# Altium schematic sheet Power-Sheet.SchDoc (part 1 of 3)
size 420 x 297 mm; SheetNumber: 2; SheetTotal: 5
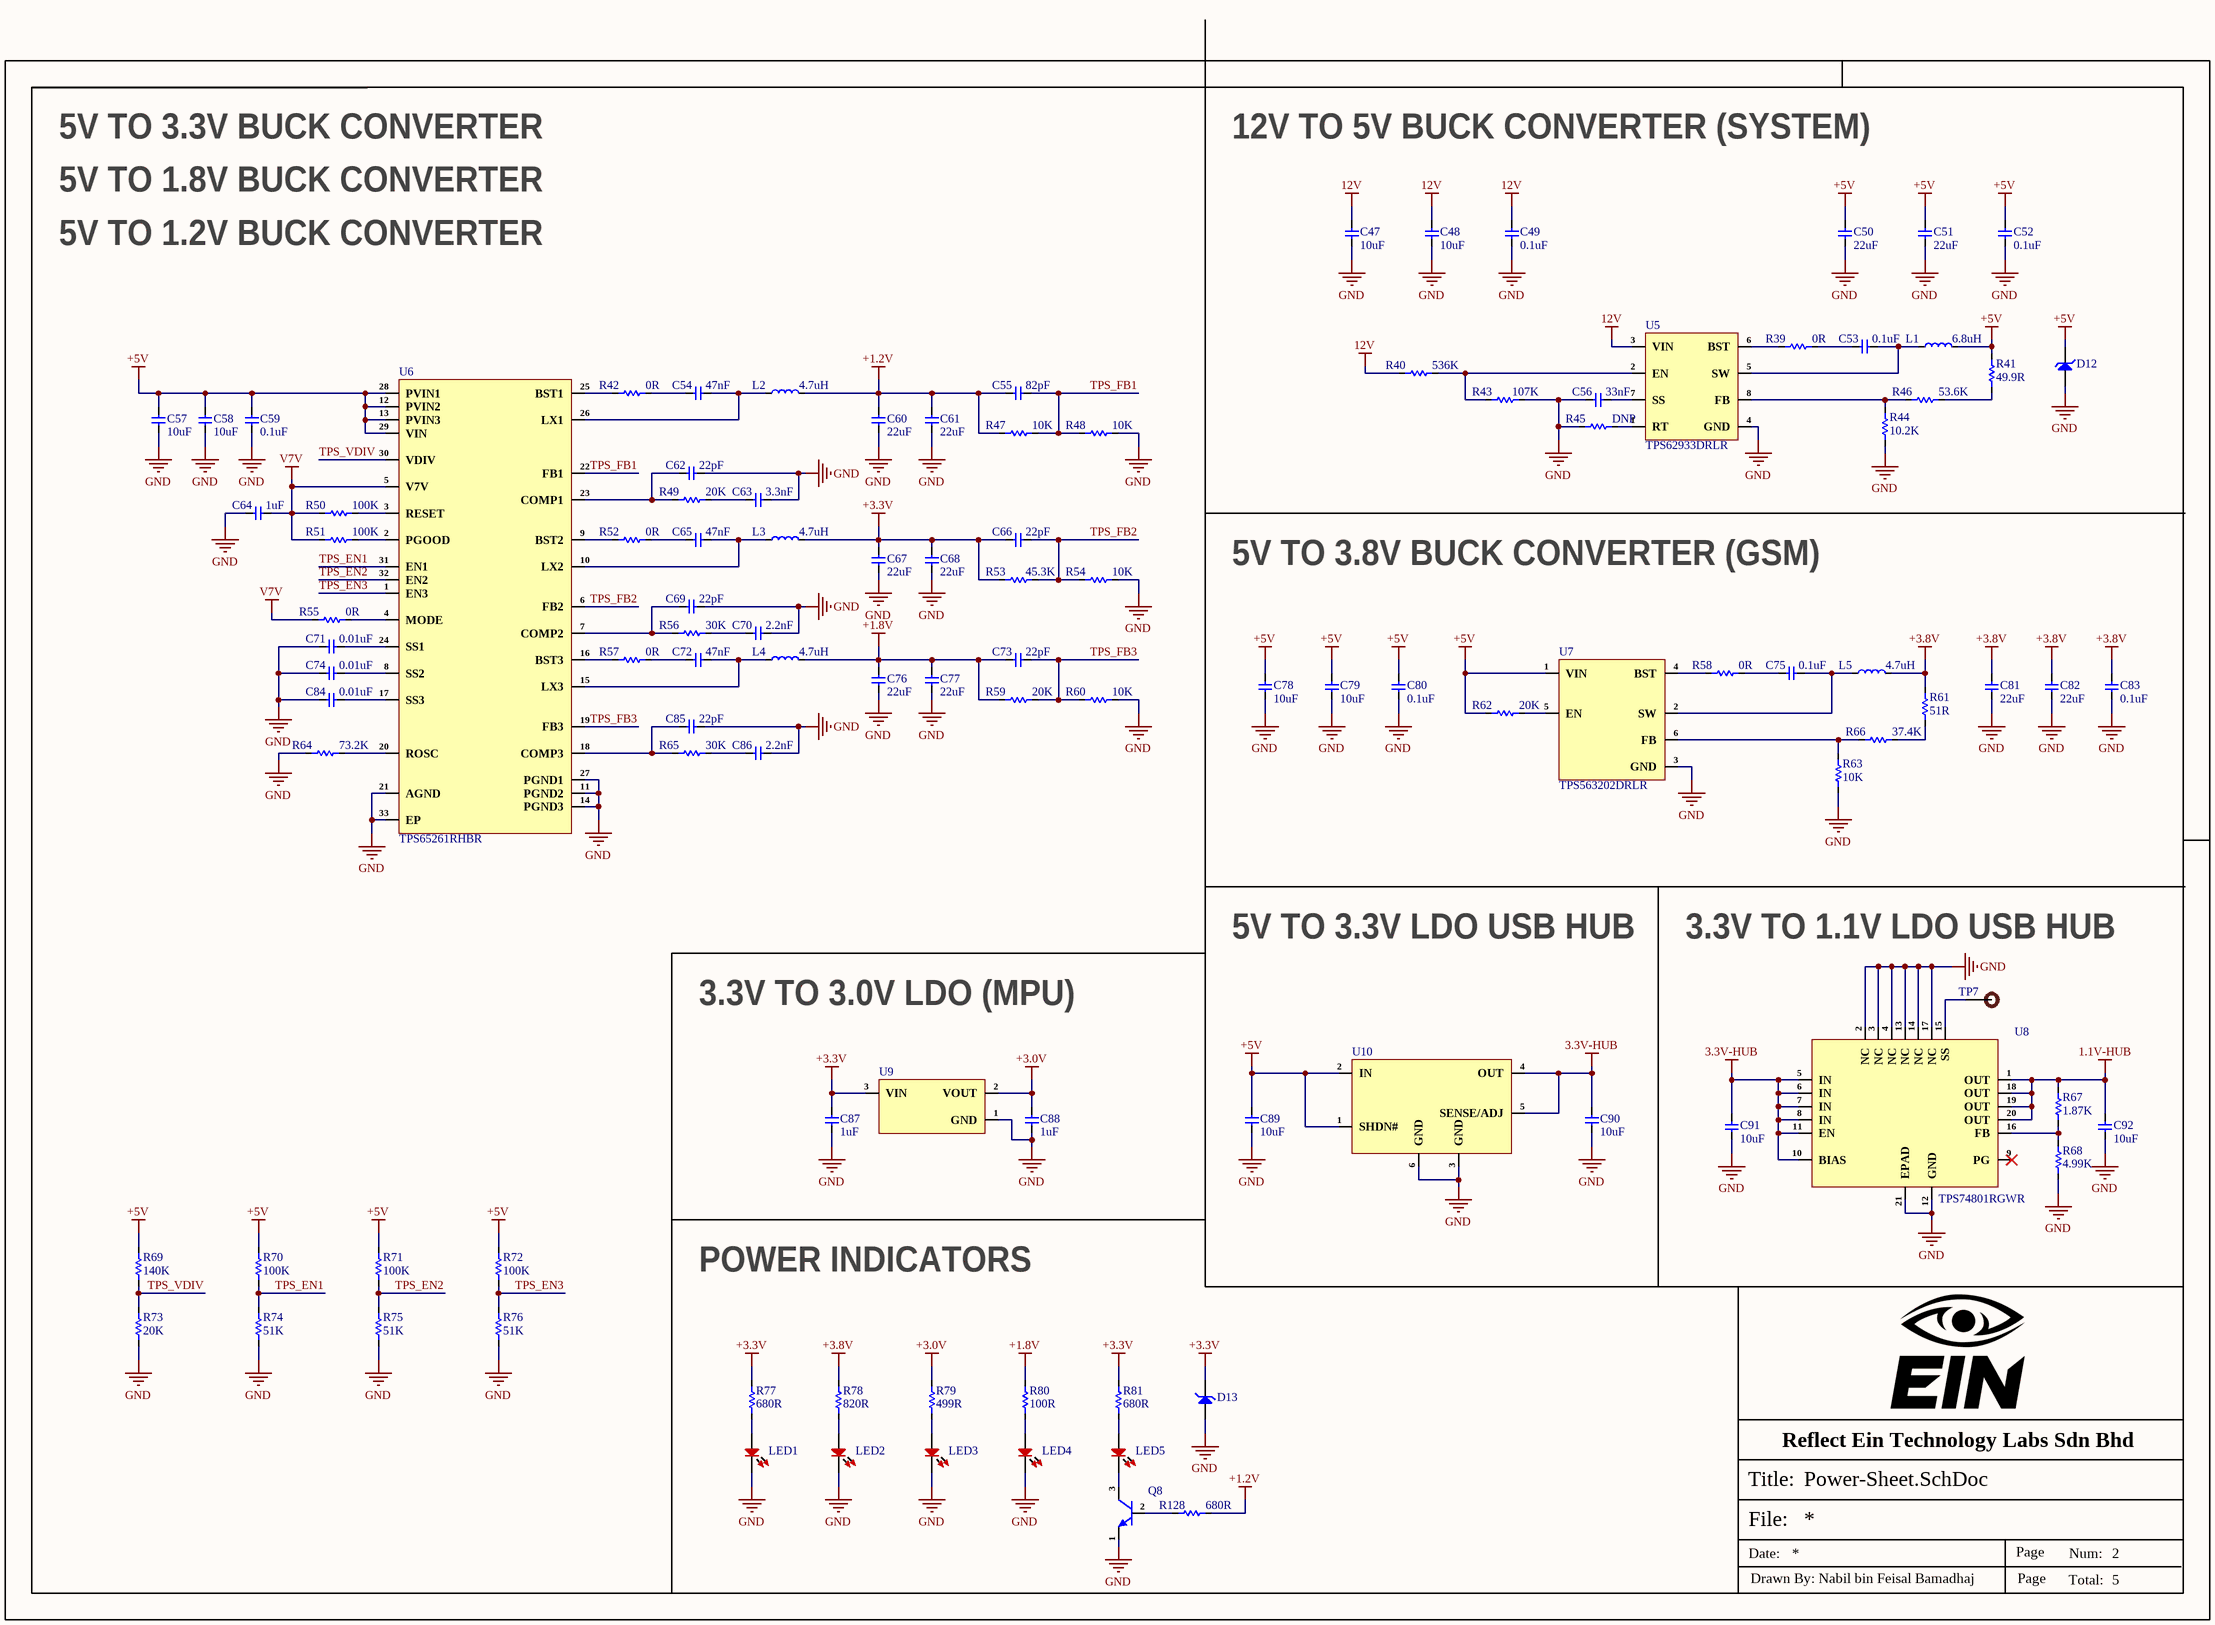
[diagram p0: Power-Sheet.SchDoc]

## Parts
C47  10uF  [Cap-1210]
C48  10uF  [Cap-1210]
C49  0.1uF  [Cap-0603]
C50  22uF  [Cap-0805]
C51  22uF  [Cap-0805]
C52  0.1uF  [Cap-0603]
C53  0.1uF  [Cap-0603]
C54  47nF  [Cap-0603]
C55  82pF  [Cap-0603]
C56  33nF  [Cap-0603]
C57  10uF  [Cap-0603]
C58  10uF  [Cap-0603]
C59  0.1uF  [Cap-0603]
C60  22uF  [Cap-0805]
C61  22uF  [Cap-0805]
C62  22pF  [Cap-0603]
C63  3.3nF  [Cap-0603]
C64  1uF  [Cap-0603]
C65  47nF  [Cap-0603]
C66  22pF  [Cap-0603]
C67  22uF  [Cap-0805]
C68  22uF  [Cap-0805]
C69  22pF  [Cap-0603]
C70  2.2nF  [Cap-0603]
C71  0.01uF  [Cap-0603]
C72  47nF  [Cap-0603]
C73  22pF  [Cap-0603]
C74  0.01uF  [Cap-0603]
C75  0.1uF  [Cap-0603]
C76  22uF  [Cap-0805]
C77  22uF  [Cap-0805]
C78  10uF  [Cap-1210]
C79  10uF  [Cap-1210]
C80  0.1uF  [Cap-0603]
C81  22uF  [Cap-0805]
C82  22uF  [Cap-0805]
C83  0.1uF  [Cap-0603]
C84  0.01uF  [Cap-0603]
C85  22pF  [Cap-0603]
C86  2.2nF  [Cap-0603]
C87  1uF  [Cap-0402]
C88  1uF  [Cap-0402]
C89  10uF  [Cap-1210]
C90  10uF  [Cap-1210]
C91  10uF  [Cap-1210]
C92  10uF  [Cap-1210]
D12  SMBJ5.0A  [SMB_]  (value not drawn)
D13  MSP3V3HM3/89A  [MicroSMP]  (value not drawn)
L1  6.8uH  [ETQP3M6R8KVN]
L2  4.7uH  [SMNR4030-4R7MT]
L3  4.7uH  [SMNR4030-4R7MT]
L4  4.7uH  [SMNR4030-4R7MT]
L5  4.7uH  [SRN4018-4R7M]
LED1  RED  [TH LED 5mm_]  (value not drawn)
LED2  RED  [LED-0603]  (value not drawn)
LED3  RED  [LED-0603]  (value not drawn)
LED4  RED  [LED-0603]  (value not drawn)
LED5  RED  [LED-0603]  (value not drawn)
Q8  MMBT3904  [SOT-23]  (value not drawn)
R39  0R  [Res-0603]
R40  536K  [Res-0603]
R41  49.9R  [Res-0603]
R42  0R  [Res-0603]
R43  107K  [Res-0603]
R44  10.2K  [Res-0603]
R45  DNP  [Res-0603]
R46  53.6K  [Res-0603]
R47  10K  [Res-0603]
R48  10K  [Res-0603]
R49  20K  [Res-0603]
R50  100K  [Res-0603]
R51  100K  [Res-0603]
R52  0R  [Res-0603]
R53  45.3K  [Res-0603]
R54  10K  [Res-0603]
R55  0R  [Res-0603]
R56  30K  [Res-0603]
R57  0R  [Res-0603]
R58  0R  [Res-0603]
R59  20K  [Res-0603]
R60  10K  [Res-0603]
R61  51R  [Res-0603]
R62  20K  [Res-0603]
R63  10K  [Res-0603]
R64  73.2K  [Res-0603]
R65  30K  [Res-0603]
R66  37.4K  [Res-0603]
R67  1.87K  [Res-0402]
R68  4.99K  [Res-0402]
R69  140K  [Res-0603]
R70  100K  [Res-0603]
R71  100K  [Res-0603]
R72  100K  [Res-0603]
R73  20K  [Res-0603]
R74  51K  [Res-0603]
R75  51K  [Res-0603]
R76  51K  [Res-0603]
R77  680R  [Res-0603]
R78  820R  [Res-0603]
R79  499R  [Res-0603]
R80  100R  [Res-0603]
R81  680R  [Res-0603]
R128  680R  [Res-0603]
TP7  TEST POINT 0.5mm Dia  [Test-point - 0.5mm]  (value not drawn)  (no BOM)
U5  TPS62933DRLR  [SOT-583]
U6  TPS65261RHBR  [32-QFN (5x5)]
U7  TPS563202DRLR  [SOT-563]
U8  TPS74801RGWR  [20-VQFN (5x5)]
U9  XC6206P302MR-G  [SOT-23]  (value not drawn)
U10  TPS7A4533DCQR  [SOT-223-6_]  (value not drawn)

## Nets
1.1V-HUB: C92.2 R67.2 U8.1(OUT) U8.18(OUT) U8.19(OUT) U8.20(OUT)
3.3V-HUB: C90.2 C91.2 U8.5(IN) U8.6(IN) U8.7(IN) U8.8(IN) U8.10(BIAS) U8.11(EN) U10.4(OUT) U10.5(SENSE/ADJ)
12V: C47.2 C48.2 C49.2 R40.1 U5.3(VIN)
+1.2V: C55.1 C60.2 C61.2 L2.2 R47.1 R128.1
+1.8V: C73.1 C76.2 C77.2 L4.2 R59.2 R80.2
+3.0V: C88.2 R79.2 U9.2(VOUT)
+3.3V: C66.1 C67.2 C68.2 C87.2 D13.2(K) L3.2 R53.1 R77.2 R81.2 U9.3(VIN)
+3.8V: C81.2 C82.2 C83.2 L5.2 R61.2 R78.2
+5V: C50.2 C51.2 C52.2 C57.2 C58.2 C59.2 C78.2 C79.2 C80.2 C89.2 D12.2(K) L1.2 R41.2 R62.1 R69.2 R70.2 R71.2 R72.2 U6.12(PVIN2) U6.13(PVIN3) U6.28(PVIN1) U6.29(VIN) U7.1(VIN) U10.1(SHDN#) U10.2(IN)
GND: C47.1 C48.1 C49.1 C50.1 C51.1 C52.1 C56.1 C57.1 C58.1 C59.1 C60.1 C61.1 C62.2 C63.2 C64.1 C67.1 C68.1 C69.2 C70.2 C71.1 C74.1 C76.1 C77.1 C78.1 C79.1 C80.1 C81.1 C82.1 C83.1 C84.1 C85.2 C86.2 C87.1 C88.1 C89.1 C90.1 C91.1 C92.1 D12.1(A) D13.1(A) LED1.1 LED2.2 LED3.2 LED4.2 Q8.1(E) R43.2 R44.1 R45.1 R48.2 R54.2 R60.2 R63.1 R64.1 R68.1 R73.1 R74.1 R75.1 R76.1 U5.4(GND) U6.11(PGND2) U6.14(PGND3) U6.21(AGND) U6.27(PGND1) U6.33(EP) U7.3(GND) U8.2(NC) U8.3(NC) U8.4(NC) U8.12(GND) U8.13(NC) U8.14(NC) U8.17(NC) U8.21(EPAD) U9.1(GND) U10.3(GND) U10.6(GND)
V7V: C64.2 R50.1 R51.1 R55.1 U6.5(V7V)
TPS_EN1: R70.1 R74.2 U6.31(EN1)
TPS_EN2: R71.1 R75.2 U6.32(EN2)
TPS_EN3: R72.1 R76.2 U6.1(EN3)
TPS_FB1: C55.2 R47.2 R48.1 U6.22(FB1)
TPS_FB2: C66.2 R53.2 R54.1 U6.6(FB2)
TPS_FB3: C73.2 R59.1 R60.1 U6.19(FB3)
TPS_VDIV: R69.1 R73.2 U6.30(VDIV)
NetC53_1: C53.1 R39.2
NetC53_2: C53.2 L1.1 U5.5(SW)
NetC54_1: C54.1 R42.2
NetC54_2: C54.2 L2.1 U6.26(LX1)
NetC56_2: C56.2 U5.7(SS)
NetC62_1: C62.1 R49.2 U6.23(COMP1)
NetC63_1: C63.1 R49.1
NetC65_1: C65.1 R52.2
NetC65_2: C65.2 L3.1 U6.10(LX2)
NetC69_1: C69.1 R56.1 U6.7(COMP2)
NetC70_1: C70.1 R56.2
NetC71_2: C71.2 U6.24(SS1)
NetC72_1: C72.1 R57.2
NetC72_2: C72.2 L4.1 U6.15(LX3)
NetC74_2: C74.2 U6.8(SS2)
NetC75_1: C75.1 R58.2
NetC75_2: C75.2 L5.1 U7.2(SW)
NetC84_2: C84.2 U6.17(SS3)
NetC85_1: C85.1 R65.1 U6.18(COMP3)
NetC86_1: C86.1 R65.2
NetLED1_2: LED1.2 R77.1
NetLED2_1: LED2.1 R78.1
NetLED3_1: LED3.1 R79.1
NetLED4_1: LED4.1 R80.1
NetLED5_1: LED5.1 R81.1
NetLED5_2: LED5.2 Q8.3(C)
NetQ8_2: Q8.2(B) R128.2
NetR39_1: R39.1 U5.6(BST)
NetR40_2: R40.2 R43.1 U5.2(EN)
NetR41_1: R41.1 R46.1
NetR42_1: R42.1 U6.25(BST1)
NetR44_2: R44.2 R46.2 U5.8(FB)
NetR45_2: R45.2 U5.1(RT)
NetR50_2: R50.2 U6.3(RESET)
NetR51_2: R51.2 U6.2(PGOOD)
NetR52_1: R52.1 U6.9(BST2)
NetR55_2: R55.2 U6.4(MODE)
NetR57_1: R57.1 U6.16(BST3)
NetR58_1: R58.1 U7.4(BST)
NetR61_1: R61.1 R66.1
NetR62_2: R62.2 U7.5(EN)
NetR63_2: R63.2 R66.2 U7.6(FB)
NetR64_2: R64.2 U6.20(ROSC)
NetR67_1: R67.1 R68.2 U8.16(FB)
NetTP7_1: TP7.1 U8.15(SS)

Not connected (* = marked no-connect by the designer): U8 9(PG)*

## Notes on the sheet
- 5V TO 3.3V BUCK CONVERTER
- 5V TO 1.8V BUCK CONVERTER
- 12V TO 5V BUCK CONVERTER (SYSTEM)
- 5V TO 1.2V BUCK CONVERTER
- 5V TO 3.8V BUCK CONVERTER (GSM)
- 5V TO 3.3V LDO USB HUB
- 3.3V TO 1.1V LDO USB HUB
- 3.3V TO 3.0V LDO (MPU)
- POWER INDICATORS
- Reflect Ein Technology Labs Sdn Bhd
- File:
- Title:
- Date:
- Page
- Num:
- Total:
- Drawn By: Nabil bin Feisal Bamadhaj